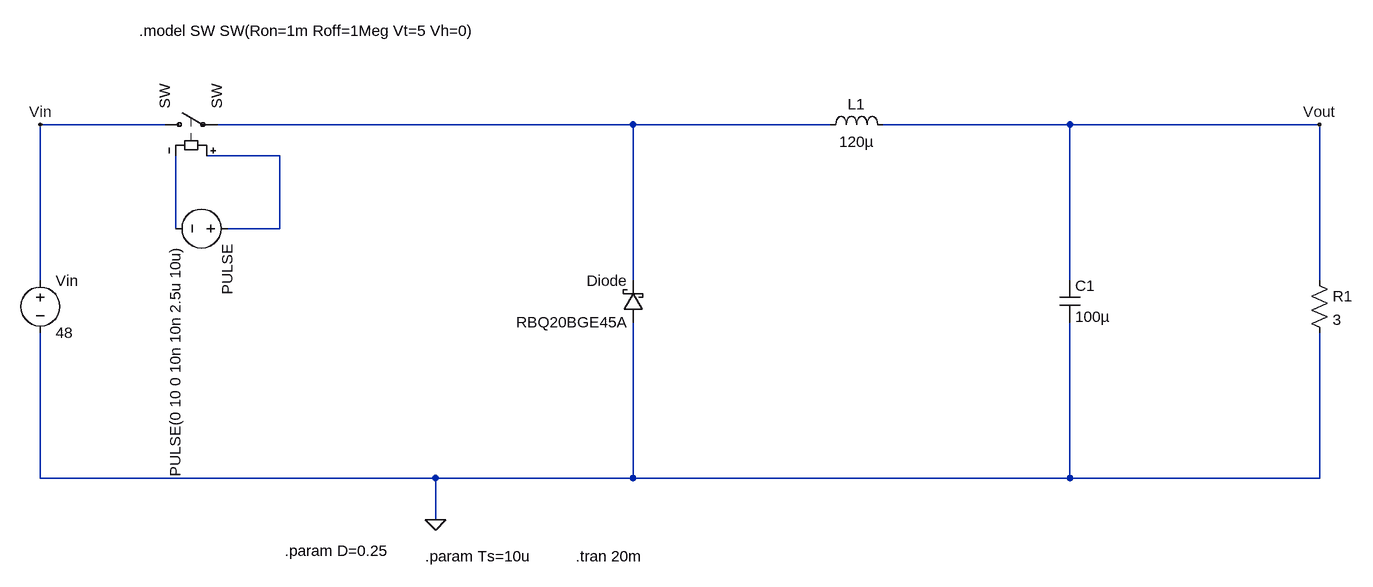
[diagram p0: schematic Design and Simulation of a 48 V to 12 V Buck Converter using LTspice-Bhadouriya.asc]
Design and Simulation of a 48 V to 12 V Buck Converter using LTspice-Bhadouriya.asc, the LTspice schematic file:
Version 4.1
SHEET 1 2112 680
WIRE 240 -128 48 -128
WIRE 960 -128 320 -128
WIRE 1264 -128 960 -128
WIRE 1632 -128 1344 -128
WIRE 2016 -128 1632 -128
WIRE 416 -80 304 -80
WIRE 256 32 256 -80
WIRE 416 32 416 -80
WIRE 416 32 336 32
WIRE 48 112 48 -128
WIRE 960 112 960 -128
WIRE 1632 112 1632 -128
WIRE 2016 112 2016 -128
WIRE 48 416 48 192
WIRE 656 416 48 416
WIRE 960 416 960 176
WIRE 960 416 656 416
WIRE 1632 416 1632 176
WIRE 1632 416 960 416
WIRE 2016 416 2016 192
WIRE 2016 416 1632 416
WIRE 656 480 656 416
FLAG 656 480 0
FLAG 2016 -128 Vout
FLAG 48 -128 Vin
SYMBOL voltage 48 96 R0
SYMATTR InstName Vin
SYMATTR Value 48
SYMBOL voltage 352 32 R90
WINDOW 123 0 0 Left 0
WINDOW 39 0 0 Left 0
SYMATTR InstName PULSE
SYMATTR Value PULSE(0 10 0 10n 10n 2.5u 10u)
SYMBOL schottky 976 176 R180
WINDOW 0 24 64 Left 2
WINDOW 3 24 0 Left 2
SYMATTR InstName Diode
SYMATTR Value RBQ20BGE45A
SYMATTR Description Diode
SYMATTR Type diode
SYMBOL ind 1248 -112 R270
WINDOW 0 32 56 VTop 2
WINDOW 3 5 56 VBottom 2
SYMATTR InstName L1
SYMATTR Value 120µ
SYMATTR SpiceLine Ipk=120 Rser=1m
SYMBOL cap 1616 112 R0
SYMATTR InstName C1
SYMATTR Value 100µ
SYMBOL res 2000 96 R0
SYMATTR InstName R1
SYMATTR Value 3
SYMBOL sw 224 -128 R270
SYMATTR InstName SW
TEXT 872 536 Left 2 !.tran 20m
TEXT 424 528 Left 2 !.param D=0.25
TEXT 640 536 Left 2 !.param Ts=10u
TEXT 200 -272 Left 2 !.model SW SW(Ron=1m Roff=1Meg Vt=5 Vh=0)

The netlist it stands for:
* Design and Simulation of a 48 V to 12 V Buck Converter using LTspice-Bhadouriya.asc
Vin Vin 0 48
V§PULSE N002 N003 PULSE(0 10 0 10n 10n 2.5u 10u)
Diode 0 N001 RBQ20BGE45A
L1 N001 Vout 120µ Ipk=120 Rser=1m
C1 Vout 0 100µ
R1 Vout 0 3
SW Vin N001 N002 N003 SW
.model D D
.lib standard.dio
.tran 20m
.param D=0.25
.param Ts=10u
.model SW SW(Ron=1m Roff=1Meg Vt=5 Vh=0)
.backanno
.end